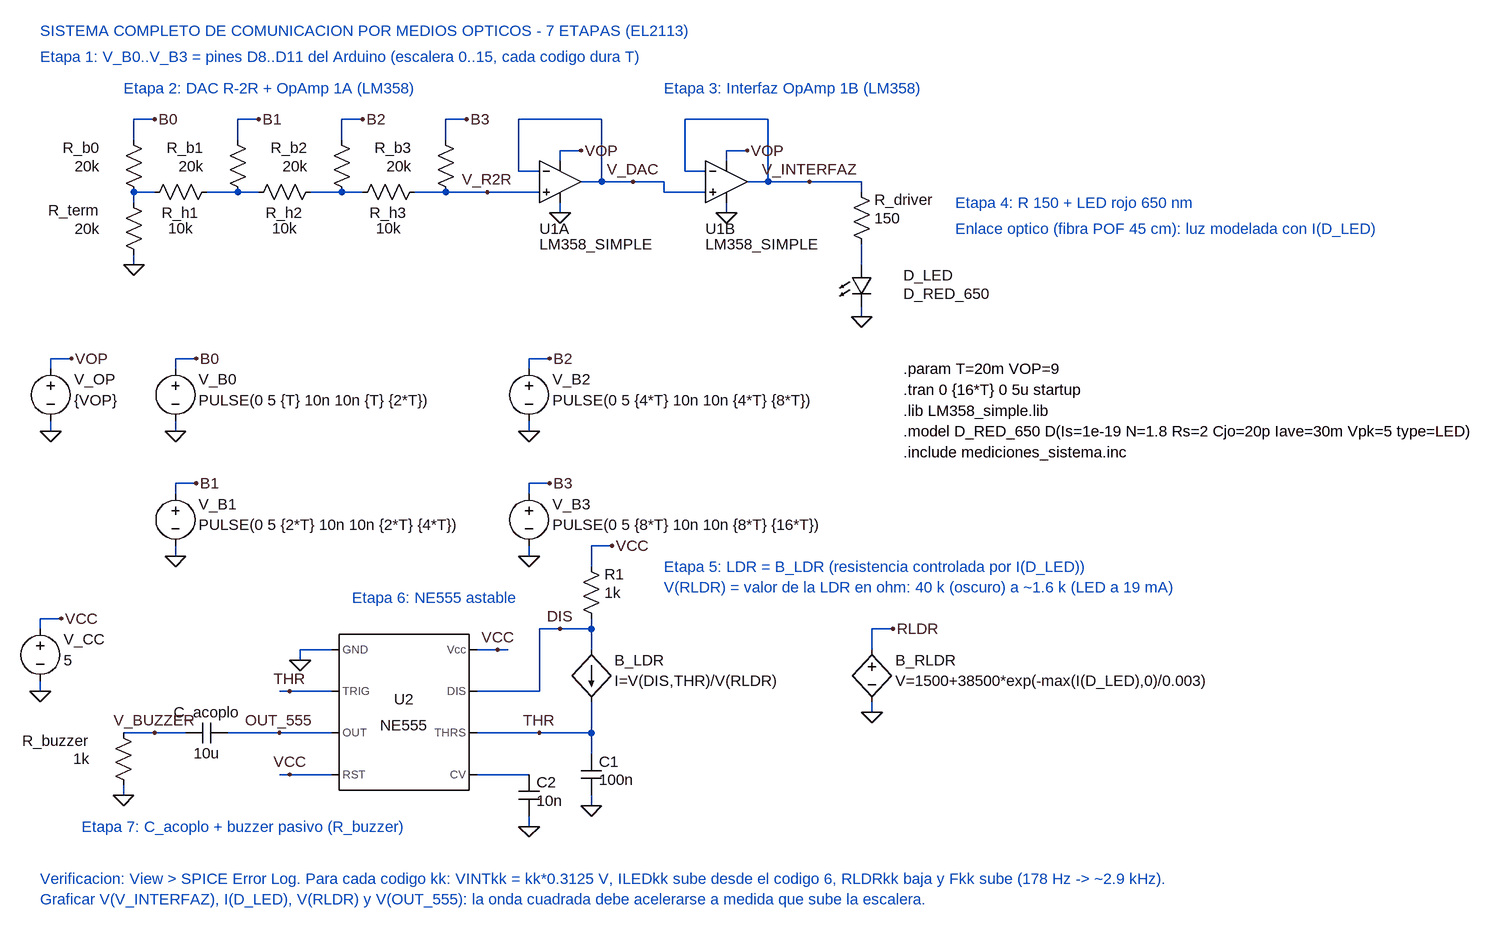
[diagram p0: schematic sistema_completo_optico.asc]
sistema_completo_optico.asc, the LTspice schematic file:
Version 4
SHEET 1 2100 1450
WIRE 224 176 256 176
WIRE 384 176 416 176
WIRE 544 176 576 176
WIRE 704 176 736 176
WIRE 816 176 944 176
WIRE 1072 176 1200 176
WIRE 224 176 224 208
WIRE 384 176 384 208
WIRE 544 176 544 208
WIRE 704 176 704 208
WIRE 880 224 912 224
WIRE 1136 224 1168 224
WIRE 880 224 880 240
WIRE 1136 224 1136 240
WIRE 816 176 816 256
WIRE 816 256 848 256
WIRE 1072 176 1072 256
WIRE 1072 256 1104 256
WIRE 944 176 944 272
WIRE 912 272 944 272
WIRE 944 272 1040 272
WIRE 1200 176 1200 272
WIRE 1168 272 1200 272
WIRE 1200 272 1344 272
WIRE 224 288 256 288
WIRE 336 288 384 288
WIRE 384 288 416 288
WIRE 496 288 544 288
WIRE 544 288 576 288
WIRE 656 288 704 288
WIRE 704 288 848 288
WIRE 1040 272 1040 288
WIRE 1040 288 1104 288
WIRE 1344 272 1344 288
WIRE 224 288 224 304
WIRE 880 304 880 320
WIRE 1136 304 1136 320
WIRE 224 384 224 400
WIRE 1344 368 1344 400
WIRE 1344 464 1344 480
WIRE 96 544 128 544
WIRE 288 544 320 544
WIRE 832 544 864 544
WIRE 96 544 96 560
WIRE 288 544 288 560
WIRE 832 544 832 560
WIRE 96 640 96 656
WIRE 288 640 288 656
WIRE 832 640 832 656
WIRE 288 736 320 736
WIRE 832 736 864 736
WIRE 288 736 288 752
WIRE 832 736 832 752
WIRE 288 832 288 848
WIRE 832 832 832 848
WIRE 928 832 960 832
WIRE 928 832 928 864
WIRE 80 944 112 944
WIRE 80 944 80 960
WIRE 928 944 928 960
WIRE 848 960 928 960
WIRE 1360 960 1392 960
WIRE 928 960 928 992
WIRE 1360 960 1360 992
WIRE 480 992 528 992
WIRE 752 992 800 992
WIRE 480 992 480 1008
WIRE 80 1040 80 1056
WIRE 448 1056 528 1056
WIRE 752 1056 848 1056
WIRE 848 960 848 1056
WIRE 1360 1072 1360 1088
WIRE 208 1120 304 1120
WIRE 368 1120 528 1120
WIRE 752 1120 928 1120
WIRE 928 1072 928 1120
WIRE 928 1120 928 1152
WIRE 448 1184 528 1184
WIRE 752 1184 832 1184
WIRE 208 1200 208 1216
WIRE 928 1216 928 1232
WIRE 832 1248 832 1264
FLAG 256 176 B0
FLAG 416 176 B1
FLAG 576 176 B2
FLAG 736 176 B3
FLAG 224 400 0
FLAG 768 288 V_R2R
FLAG 912 224 VOP
FLAG 880 320 0
FLAG 992 272 V_DAC
FLAG 1168 224 VOP
FLAG 1136 320 0
FLAG 1264 272 V_INTERFAZ
FLAG 1344 480 0
FLAG 128 544 VOP
FLAG 96 656 0
FLAG 320 544 B0
FLAG 288 656 0
FLAG 320 736 B1
FLAG 288 848 0
FLAG 864 544 B2
FLAG 832 656 0
FLAG 864 736 B3
FLAG 832 848 0
FLAG 112 944 VCC
FLAG 80 1056 0
FLAG 480 1008 0
FLAG 464 1056 THR
FLAG 448 1120 OUT_555
FLAG 464 1184 VCC
FLAG 784 992 VCC
FLAG 960 832 VCC
FLAG 880 960 DIS
FLAG 848 1120 THR
FLAG 928 1232 0
FLAG 832 1264 0
FLAG 256 1120 V_BUZZER
FLAG 208 1216 0
FLAG 1392 960 RLDR
FLAG 1360 1088 0
SYMBOL res 208 192 R0
WINDOW 0 -36 28 Right 2
WINDOW 3 -36 56 Right 2
SYMATTR InstName R_b0
SYMATTR Value 20k
SYMBOL res 368 192 R0
WINDOW 0 -36 28 Right 2
WINDOW 3 -36 56 Right 2
SYMATTR InstName R_b1
SYMATTR Value 20k
SYMBOL res 528 192 R0
WINDOW 0 -36 28 Right 2
WINDOW 3 -36 56 Right 2
SYMATTR InstName R_b2
SYMATTR Value 20k
SYMBOL res 688 192 R0
WINDOW 0 -36 28 Right 2
WINDOW 3 -36 56 Right 2
SYMATTR InstName R_b3
SYMATTR Value 20k
SYMBOL res 352 272 R90
WINDOW 0 32 56 VTop 2
WINDOW 3 56 56 VTop 2
SYMATTR InstName R_h1
SYMATTR Value 10k
SYMBOL res 512 272 R90
WINDOW 0 32 56 VTop 2
WINDOW 3 56 56 VTop 2
SYMATTR InstName R_h2
SYMATTR Value 10k
SYMBOL res 672 272 R90
WINDOW 0 32 56 VTop 2
WINDOW 3 56 56 VTop 2
SYMATTR InstName R_h3
SYMATTR Value 10k
SYMBOL res 208 288 R0
WINDOW 0 -36 28 Right 2
WINDOW 3 -36 56 Right 2
SYMATTR InstName R_term
SYMATTR Value 20k
SYMBOL OpAmps\\opamp2 880 208 R0
WINDOW 0 -32 136 Left 2
WINDOW 3 -32 160 Left 2
SYMATTR InstName U1A
SYMATTR Value LM358_SIMPLE
SYMBOL OpAmps\\opamp2 1136 208 R0
WINDOW 0 -32 136 Left 2
WINDOW 3 -32 160 Left 2
SYMATTR InstName U1B
SYMATTR Value LM358_SIMPLE
SYMBOL res 1328 272 R0
WINDOW 0 36 28 Left 2
WINDOW 3 36 56 Left 2
SYMATTR InstName R_driver
SYMATTR Value 150
SYMBOL LED 1328 400 R0
WINDOW 0 80 16 Left 2
WINDOW 3 80 44 Left 2
SYMATTR InstName D_LED
SYMATTR Value D_RED_650
SYMBOL voltage 96 544 R0
WINDOW 0 36 32 Left 2
WINDOW 3 36 64 Left 2
SYMATTR InstName V_OP
SYMATTR Value {VOP}
SYMBOL voltage 288 544 R0
WINDOW 0 36 32 Left 2
WINDOW 3 36 64 Left 2
SYMATTR InstName V_B0
SYMATTR Value PULSE(0 5 {T} 10n 10n {T} {2*T})
SYMBOL voltage 288 736 R0
WINDOW 0 36 32 Left 2
WINDOW 3 36 64 Left 2
SYMATTR InstName V_B1
SYMATTR Value PULSE(0 5 {2*T} 10n 10n {2*T} {4*T})
SYMBOL voltage 832 544 R0
WINDOW 0 36 32 Left 2
WINDOW 3 36 64 Left 2
SYMATTR InstName V_B2
SYMATTR Value PULSE(0 5 {4*T} 10n 10n {4*T} {8*T})
SYMBOL voltage 832 736 R0
WINDOW 0 36 32 Left 2
WINDOW 3 36 64 Left 2
SYMATTR InstName V_B3
SYMATTR Value PULSE(0 5 {8*T} 10n 10n {8*T} {16*T})
SYMBOL voltage 80 944 R0
WINDOW 0 36 32 Left 2
WINDOW 3 36 64 Left 2
SYMATTR InstName V_CC
SYMATTR Value 5
SYMBOL Misc\\NE555 640 1088 R0
SYMATTR InstName U2
SYMBOL res 912 848 R0
WINDOW 0 36 28 Left 2
WINDOW 3 36 56 Left 2
SYMATTR InstName R1
SYMATTR Value 1k
SYMBOL bi 928 992 R0
WINDOW 0 36 16 Left 2
WINDOW 3 36 48 Left 2
SYMATTR InstName B_LDR
SYMATTR Value I=V(DIS,THR)/V(RLDR)
SYMBOL bv 1360 976 R0
WINDOW 0 36 32 Left 2
WINDOW 3 36 64 Left 2
SYMATTR InstName B_RLDR
SYMATTR Value V=1500+38500*exp(-max(I(D_LED),0)/0.003)
SYMBOL cap 912 1152 R0
WINDOW 0 28 12 Left 2
WINDOW 3 28 40 Left 2
SYMATTR InstName C1
SYMATTR Value 100n
SYMBOL cap 816 1184 R0
WINDOW 0 28 12 Left 2
WINDOW 3 28 40 Left 2
SYMATTR InstName C2
SYMATTR Value 10n
SYMBOL cap 368 1104 R90
WINDOW 0 0 32 VBottom 2
WINDOW 3 32 32 VTop 2
SYMATTR InstName C_acoplo
SYMATTR Value 10u
SYMBOL res 192 1104 R0
WINDOW 0 -36 28 Right 2
WINDOW 3 -36 56 Right 2
SYMATTR InstName R_buzzer
SYMATTR Value 1k
TEXT 80 40 Left 2 ;SISTEMA COMPLETO DE COMUNICACION POR MEDIOS OPTICOS - 7 ETAPAS (EL2113)
TEXT 80 80 Left 2 ;Etapa 1: V_B0..V_B3 = pines D8..D11 del Arduino (escalera 0..15, cada codigo dura T)
TEXT 208 128 Left 2 ;Etapa 2: DAC R-2R + OpAmp 1A (LM358)
TEXT 1040 128 Left 2 ;Etapa 3: Interfaz OpAmp 1B (LM358)
TEXT 1488 304 Left 2 ;Etapa 4: R 150 + LED rojo 650 nm
TEXT 1488 344 Left 2 ;Enlace optico (fibra POF 45 cm): luz modelada con I(D_LED)
TEXT 1040 864 Left 2 ;Etapa 5: LDR = B_LDR (resistencia controlada por I(D_LED))
TEXT 1040 896 Left 2 ;V(RLDR) = valor de la LDR en ohm: 40 k (oscuro) a ~1.6 k (LED a 19 mA)
TEXT 560 912 Left 2 ;Etapa 6: NE555 astable
TEXT 144 1264 Left 2 ;Etapa 7: C_acoplo + buzzer pasivo (R_buzzer)
TEXT 1408 560 Left 2 !.param T=20m VOP=9
TEXT 1408 592 Left 2 !.tran 0 {16*T} 0 5u startup
TEXT 1408 624 Left 2 !.lib LM358_simple.lib
TEXT 1408 656 Left 2 !.model D_RED_650 D(Is=1e-19 N=1.8 Rs=2 Cjo=20p Iave=30m Vpk=5 type=LED)
TEXT 1408 688 Left 2 !.include mediciones_sistema.inc
TEXT 80 1344 Left 2 ;Verificacion: View > SPICE Error Log. Para cada codigo kk: VINTkk = kk*0.3125 V, ILEDkk sube desde el codigo 6, RLDRkk baja y Fkk sube (178 Hz -> ~2.9 kHz).
TEXT 80 1376 Left 2 ;Graficar V(V_INTERFAZ), I(D_LED), V(RLDR) y V(OUT_555): la onda cuadrada debe acelerarse a medida que sube la escalera.

The netlist it stands for:
* sistema_completo_optico.asc
R_b0 B0 N001 20k
R_b1 B1 N002 20k
R_b2 B2 N003 20k
R_b3 B3 V_R2R 20k
R_h1 N002 N001 10k
R_h2 N003 N002 10k
R_h3 V_R2R N003 10k
R_term N001 0 20k
XU1A V_R2R V_DAC VOP 0 V_DAC LM358_SIMPLE  ; pins In+ In- V+ V- OUT
XU1B V_DAC V_INTERFAZ VOP 0 V_INTERFAZ LM358_SIMPLE  ; pins In+ In- V+ V- OUT
R_driver V_INTERFAZ N004 150
D_LED N004 0 D_RED_650
V_OP VOP 0 {VOP}
V_B0 B0 0 PULSE(0 5 {T} 10n 10n {T} {2*T})
V_B1 B1 0 PULSE(0 5 {2*T} 10n 10n {2*T} {4*T})
V_B2 B2 0 PULSE(0 5 {4*T} 10n 10n {4*T} {8*T})
V_B3 B3 0 PULSE(0 5 {8*T} 10n 10n {8*T} {16*T})
V_CC VCC 0 5
XU2 0 THR OUT_555 VCC N005 THR DIS VCC NE555  ; pins GND TRIG OUT RST CV THRS DIS Vcc
R1 VCC DIS 1k
B_LDR DIS THR I=V(DIS,THR)/V(RLDR)
B_RLDR RLDR 0 V=1500+38500*exp(-max(I(D_LED),0)/0.003)
C1 THR 0 100n
C2 N005 0 10n
C_acoplo OUT_555 V_BUZZER 10u
R_buzzer V_BUZZER 0 1k
.model D D
.lib standard.dio
* SISTEMA COMPLETO DE COMUNICACION POR MEDIOS OPTICOS - 7 ETAPAS (EL2113)
* Etapa 1: V_B0..V_B3 = pines D8..D11 del Arduino (escalera 0..15, cada codigo dura T)
* Etapa 2: DAC R-2R + OpAmp 1A (LM358)
* Etapa 3: Interfaz OpAmp 1B (LM358)
* Etapa 4: R 150 + LED rojo 650 nm
* Enlace optico (fibra POF 45 cm): luz modelada con I(D_LED)
* Etapa 5: LDR = B_LDR (resistencia controlada por I(D_LED))
* V(RLDR) = valor de la LDR en ohm: 40 k (oscuro) a ~1.6 k (LED a 19 mA)
* Etapa 6: NE555 astable
* Etapa 7: C_acoplo + buzzer pasivo (R_buzzer)
.param T=20m VOP=9
.tran 0 {16*T} 0 5u startup
.lib LM358_simple.lib
.model D_RED_650 D(Is=1e-19 N=1.8 Rs=2 Cjo=20p Iave=30m Vpk=5 type=LED)
.include mediciones_sistema.inc
* Verificacion: View > SPICE Error Log. Para cada codigo kk: VINTkk = kk*0.3125 V, ILEDkk sube desde el codigo 6, RLDRkk baja y Fkk sube (178 Hz -> ~2.9 kHz).
* Graficar V(V_INTERFAZ), I(D_LED), V(RLDR) y V(OUT_555): la onda cuadrada debe acelerarse a medida que sube la escalera.
.lib NE555.sub
.backanno
.end